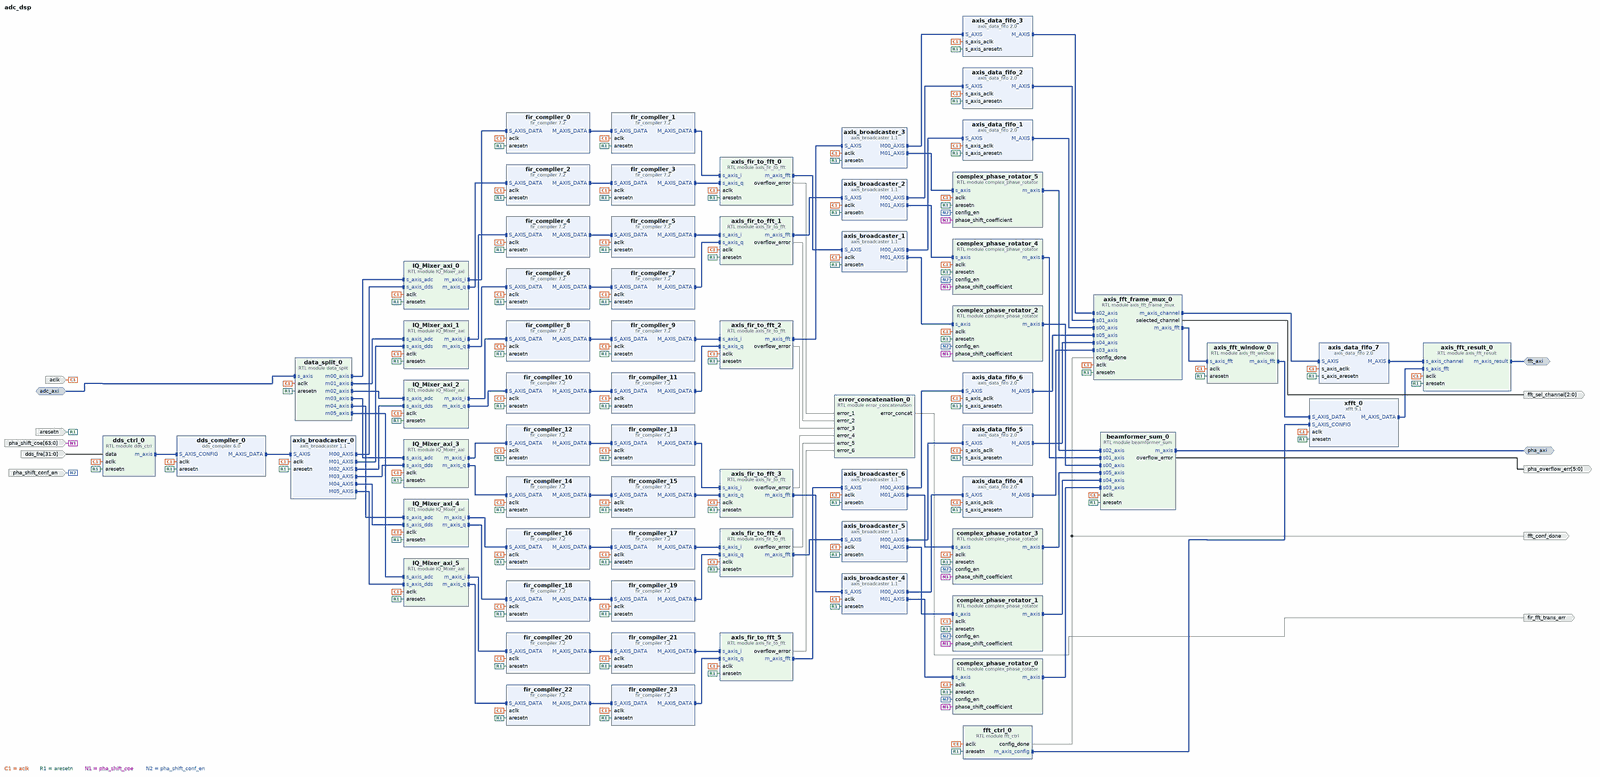
[diagram p0: block diagram of the top level, whole]
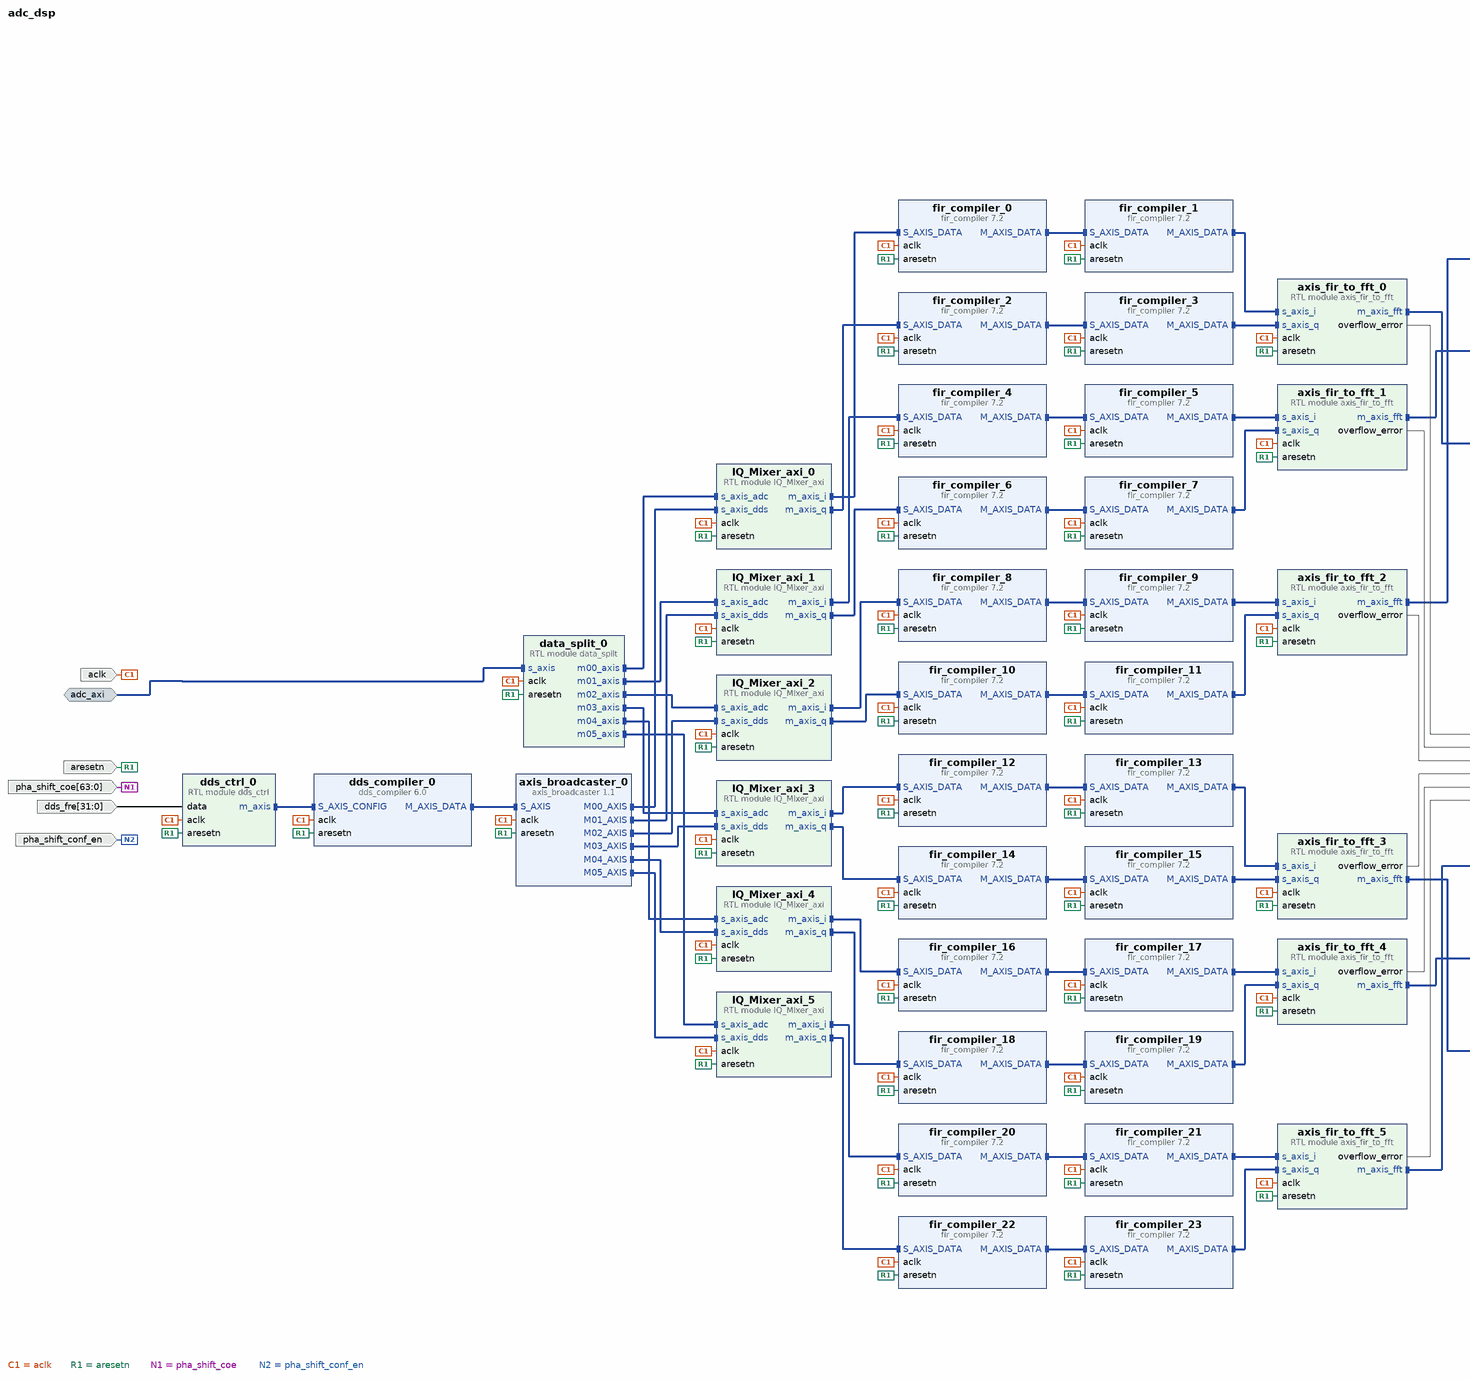
[diagram p1: block diagram of the top level, left part]
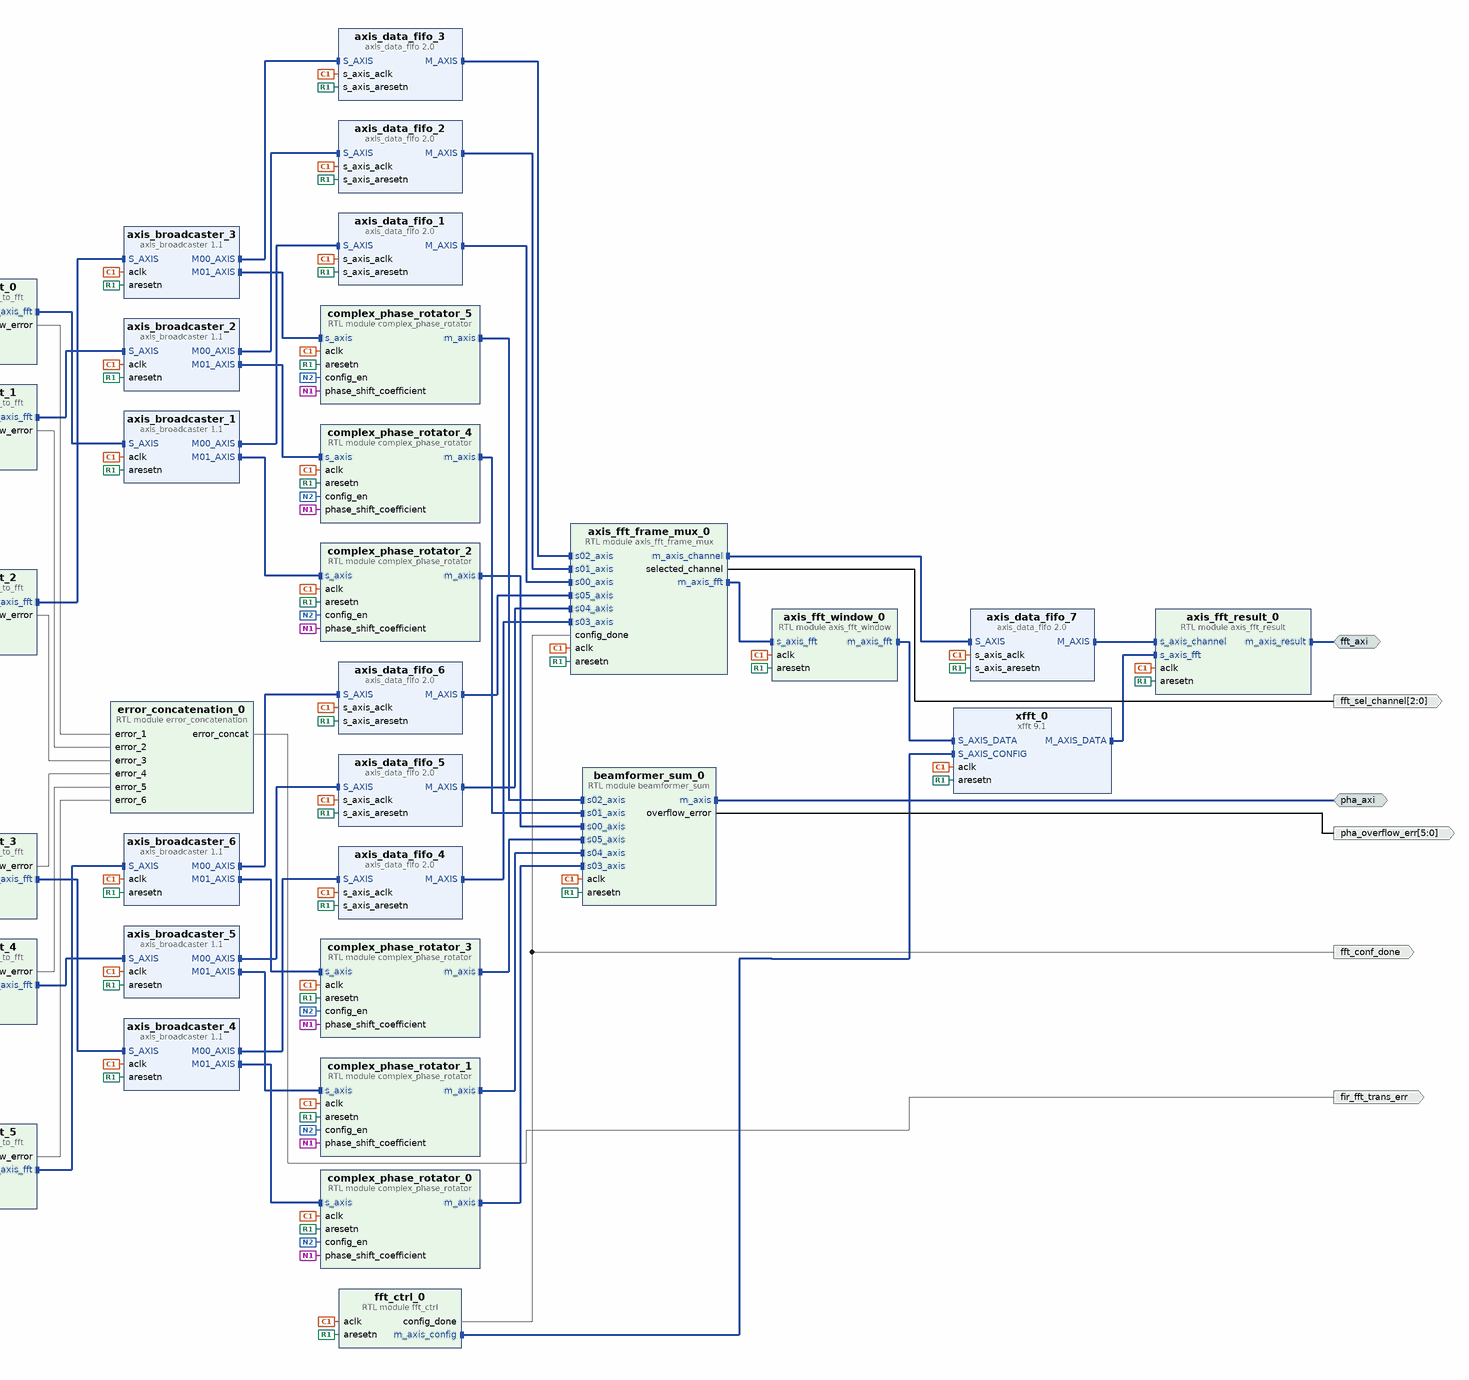
[diagram p2: block diagram of the top level, right part]
# Vivado block design adc_dsp, xc7z030ffg676-2, Vivado 2018.3
create_bd_design adc_dsp

create_bd_intf_port -mode Slave -vlnv xilinx.com:interface:axis_rtl:1.0 adc_axi
set_property -dict [list \
  CONFIG.HAS_TKEEP 0 \
  CONFIG.HAS_TLAST 0 \
  CONFIG.HAS_TREADY 1 \
  CONFIG.HAS_TSTRB 0 \
  CONFIG.LAYERED_METADATA undef \
  CONFIG.TDATA_NUM_BYTES 12 \
  CONFIG.TDEST_WIDTH 0 \
  CONFIG.TID_WIDTH 0 \
  CONFIG.TUSER_WIDTH 0 \
] [get_bd_intf_ports adc_axi]
create_bd_intf_port -mode Master -vlnv xilinx.com:interface:axis_rtl:1.0 fft_axi
create_bd_intf_port -mode Master -vlnv xilinx.com:interface:axis_rtl:1.0 pha_axi
create_bd_port -dir I -from 31 -to 0 dds_fre
create_bd_port -dir O fft_conf_done
create_bd_port -dir O fir_fft_trans_err
create_bd_port -dir I -type clk aclk
create_bd_port -dir I -type rst aresetn
create_bd_port -dir O -from 2 -to 0 fft_sel_channel
create_bd_port -dir O -from 5 -to 0 pha_overflow_err
create_bd_port -dir I -from 63 -to 0 pha_shift_coe
create_bd_port -dir I pha_shift_conf_en

create_bd_cell -type module -reference data_split data_split_0
create_bd_cell -type ip -vlnv xilinx.com:ip:dds_compiler:6.0 dds_compiler_0
set_property -dict [list \
  CONFIG.DATA_Has_TLAST Not_Required \
  CONFIG.Frequency_Resolution 0.4 \
  CONFIG.Has_ARESETn true \
  CONFIG.Has_Phase_Out false \
  CONFIG.Has_TREADY true \
  CONFIG.Latency 16 \
  CONFIG.Latency_Configuration Auto \
  CONFIG.M_DATA_Has_TUSER Not_Required \
  CONFIG.Negative_Sine true \
  CONFIG.Noise_Shaping Taylor_Series_Corrected \
  CONFIG.Output_Frequency1 0 \
  CONFIG.Output_Width 24 \
  CONFIG.PINC1 0 \
  CONFIG.Parameter_Entry Hardware_Parameters \
  CONFIG.Phase_Increment Programmable \
  CONFIG.Phase_Width 32 \
  CONFIG.S_PHASE_Has_TUSER Not_Required \
] [get_bd_cells dds_compiler_0]
create_bd_cell -type ip -vlnv xilinx.com:ip:axis_broadcaster:1.1 axis_broadcaster_0
set_property -dict [list \
  CONFIG.HAS_TREADY 1 \
  CONFIG.M00_TDATA_REMAP {tdata[47:0]} \
  CONFIG.M01_TDATA_REMAP {tdata[47:0]} \
  CONFIG.M02_TDATA_REMAP {tdata[47:0]} \
  CONFIG.M03_TDATA_REMAP {tdata[47:0]} \
  CONFIG.M04_TDATA_REMAP {tdata[47:0]} \
  CONFIG.M05_TDATA_REMAP {tdata[47:0]} \
  CONFIG.M_TDATA_NUM_BYTES 6 \
  CONFIG.NUM_MI 6 \
  CONFIG.S_TDATA_NUM_BYTES 6 \
] [get_bd_cells axis_broadcaster_0]
create_bd_cell -type module -reference dds_ctrl dds_ctrl_0
create_bd_cell -type ip -vlnv xilinx.com:ip:xfft:9.1 xfft_0
set_property -dict [list \
  CONFIG.aresetn true \
  CONFIG.channels 1 \
  CONFIG.implementation_options pipelined_streaming_io \
  CONFIG.input_width 26 \
  CONFIG.number_of_stages_using_block_ram_for_data_and_phase_factors 5 \
  CONFIG.output_ordering natural_order \
  CONFIG.phase_factor_width 24 \
  CONFIG.rounding_modes convergent_rounding \
  CONFIG.scaling_options unscaled \
  CONFIG.target_clock_frequency 100 \
  CONFIG.target_data_throughput 50 \
  CONFIG.transform_length 4096 \
  CONFIG.xk_index false \
] [get_bd_cells xfft_0]
create_bd_cell -type module -reference IQ_Mixer_axi IQ_Mixer_axi_0
create_bd_cell -type module -reference IQ_Mixer_axi IQ_Mixer_axi_1
create_bd_cell -type module -reference IQ_Mixer_axi IQ_Mixer_axi_2
create_bd_cell -type module -reference IQ_Mixer_axi IQ_Mixer_axi_3
create_bd_cell -type module -reference IQ_Mixer_axi IQ_Mixer_axi_4
create_bd_cell -type module -reference IQ_Mixer_axi IQ_Mixer_axi_5
create_bd_cell -type ip -vlnv xilinx.com:ip:axis_broadcaster:1.1 axis_broadcaster_1
set_property -dict [list \
  CONFIG.HAS_TLAST 1 \
  CONFIG.HAS_TREADY 1 \
  CONFIG.M00_TDATA_REMAP {tdata[63:0]} \
  CONFIG.M01_TDATA_REMAP {tdata[63:0]} \
  CONFIG.M02_TDATA_REMAP {tdata[47:0]} \
  CONFIG.M03_TDATA_REMAP {tdata[47:0]} \
  CONFIG.M04_TDATA_REMAP {tdata[47:0]} \
  CONFIG.M05_TDATA_REMAP {tdata[47:0]} \
  CONFIG.M_TDATA_NUM_BYTES 8 \
  CONFIG.NUM_MI 2 \
  CONFIG.S_TDATA_NUM_BYTES 8 \
] [get_bd_cells axis_broadcaster_1]
create_bd_cell -type ip -vlnv xilinx.com:ip:axis_broadcaster:1.1 axis_broadcaster_2
set_property -dict [list \
  CONFIG.HAS_TLAST 1 \
  CONFIG.HAS_TREADY 1 \
  CONFIG.M00_TDATA_REMAP {tdata[63:0]} \
  CONFIG.M01_TDATA_REMAP {tdata[63:0]} \
  CONFIG.M02_TDATA_REMAP {tdata[47:0]} \
  CONFIG.M03_TDATA_REMAP {tdata[47:0]} \
  CONFIG.M04_TDATA_REMAP {tdata[47:0]} \
  CONFIG.M05_TDATA_REMAP {tdata[47:0]} \
  CONFIG.M_TDATA_NUM_BYTES 8 \
  CONFIG.NUM_MI 2 \
  CONFIG.S_TDATA_NUM_BYTES 8 \
] [get_bd_cells axis_broadcaster_2]
create_bd_cell -type ip -vlnv xilinx.com:ip:axis_broadcaster:1.1 axis_broadcaster_3
set_property -dict [list \
  CONFIG.HAS_TLAST 1 \
  CONFIG.HAS_TREADY 1 \
  CONFIG.M00_TDATA_REMAP {tdata[63:0]} \
  CONFIG.M01_TDATA_REMAP {tdata[63:0]} \
  CONFIG.M02_TDATA_REMAP {tdata[47:0]} \
  CONFIG.M03_TDATA_REMAP {tdata[47:0]} \
  CONFIG.M04_TDATA_REMAP {tdata[47:0]} \
  CONFIG.M05_TDATA_REMAP {tdata[47:0]} \
  CONFIG.M_TDATA_NUM_BYTES 8 \
  CONFIG.NUM_MI 2 \
  CONFIG.S_TDATA_NUM_BYTES 8 \
] [get_bd_cells axis_broadcaster_3]
create_bd_cell -type ip -vlnv xilinx.com:ip:axis_broadcaster:1.1 axis_broadcaster_4
set_property -dict [list \
  CONFIG.HAS_TLAST 1 \
  CONFIG.HAS_TREADY 1 \
  CONFIG.M00_TDATA_REMAP {tdata[63:0]} \
  CONFIG.M01_TDATA_REMAP {tdata[63:0]} \
  CONFIG.M02_TDATA_REMAP {tdata[47:0]} \
  CONFIG.M03_TDATA_REMAP {tdata[47:0]} \
  CONFIG.M04_TDATA_REMAP {tdata[47:0]} \
  CONFIG.M05_TDATA_REMAP {tdata[47:0]} \
  CONFIG.M_TDATA_NUM_BYTES 8 \
  CONFIG.NUM_MI 2 \
  CONFIG.S_TDATA_NUM_BYTES 8 \
] [get_bd_cells axis_broadcaster_4]
create_bd_cell -type ip -vlnv xilinx.com:ip:axis_broadcaster:1.1 axis_broadcaster_5
set_property -dict [list \
  CONFIG.HAS_TLAST 1 \
  CONFIG.HAS_TREADY 1 \
  CONFIG.M00_TDATA_REMAP {tdata[63:0]} \
  CONFIG.M01_TDATA_REMAP {tdata[63:0]} \
  CONFIG.M02_TDATA_REMAP {tdata[47:0]} \
  CONFIG.M03_TDATA_REMAP {tdata[47:0]} \
  CONFIG.M04_TDATA_REMAP {tdata[47:0]} \
  CONFIG.M05_TDATA_REMAP {tdata[47:0]} \
  CONFIG.M_TDATA_NUM_BYTES 8 \
  CONFIG.NUM_MI 2 \
  CONFIG.S_TDATA_NUM_BYTES 8 \
] [get_bd_cells axis_broadcaster_5]
create_bd_cell -type ip -vlnv xilinx.com:ip:axis_broadcaster:1.1 axis_broadcaster_6
set_property -dict [list \
  CONFIG.HAS_TLAST 1 \
  CONFIG.HAS_TREADY 1 \
  CONFIG.M00_TDATA_REMAP {tdata[63:0]} \
  CONFIG.M01_TDATA_REMAP {tdata[63:0]} \
  CONFIG.M02_TDATA_REMAP {tdata[47:0]} \
  CONFIG.M03_TDATA_REMAP {tdata[47:0]} \
  CONFIG.M04_TDATA_REMAP {tdata[47:0]} \
  CONFIG.M05_TDATA_REMAP {tdata[47:0]} \
  CONFIG.M_TDATA_NUM_BYTES 8 \
  CONFIG.NUM_MI 2 \
  CONFIG.S_TDATA_NUM_BYTES 8 \
] [get_bd_cells axis_broadcaster_6]
create_bd_cell -type module -reference fft_ctrl fft_ctrl_0
create_bd_cell -type ip -vlnv xilinx.com:ip:fir_compiler:7.2 fir_compiler_0
set_property -dict [list \
  CONFIG.Clock_Frequency 100 \
  CONFIG.CoefficientSource COE_File \
  CONFIG.Coefficient_File ../../../../../../fpai_demo_vivado.srcs/adc_dsp/coe/stage1_hb_19taps_w18_q17.coe \
  CONFIG.Coefficient_Fractional_Bits 0 \
  CONFIG.Coefficient_Sets 1 \
  CONFIG.Coefficient_Sign Signed \
  CONFIG.Coefficient_Structure Inferred \
  CONFIG.Coefficient_Width 18 \
  CONFIG.ColumnConfig 3 \
  CONFIG.Data_Fractional_Bits 0 \
  CONFIG.Data_Sign Signed \
  CONFIG.Data_Width 24 \
  CONFIG.Decimation_Rate 2 \
  CONFIG.Filter_Architecture Systolic_Multiply_Accumulate \
  CONFIG.Filter_Type Decimation \
  CONFIG.Has_ARESETn true \
  CONFIG.Interpolation_Rate 1 \
  CONFIG.M_DATA_Has_TREADY true \
  CONFIG.Number_Channels 1 \
  CONFIG.Output_Rounding_Mode Convergent_Rounding_to_Even \
  CONFIG.Output_Width 24 \
  CONFIG.Quantization Integer_Coefficients \
  CONFIG.RateSpecification Frequency_Specification \
  CONFIG.Sample_Frequency 100 \
  CONFIG.Zero_Pack_Factor 1 \
] [get_bd_cells fir_compiler_0]
create_bd_cell -type ip -vlnv xilinx.com:ip:fir_compiler:7.2 fir_compiler_1
set_property -dict [list \
  CONFIG.Clock_Frequency 100 \
  CONFIG.CoefficientSource COE_File \
  CONFIG.Coefficient_File ../../../../../../fpai_demo_vivado.srcs/adc_dsp/coe/stage2_lp_80taps_w18_q17.coe \
  CONFIG.Coefficient_Fractional_Bits 0 \
  CONFIG.Coefficient_Sets 1 \
  CONFIG.Coefficient_Sign Signed \
  CONFIG.Coefficient_Structure Inferred \
  CONFIG.Coefficient_Width 18 \
  CONFIG.ColumnConfig 10 \
  CONFIG.Data_Width 24 \
  CONFIG.Decimation_Rate 2 \
  CONFIG.Filter_Architecture Systolic_Multiply_Accumulate \
  CONFIG.Filter_Type Decimation \
  CONFIG.Has_ARESETn true \
  CONFIG.Interpolation_Rate 1 \
  CONFIG.M_DATA_Has_TREADY true \
  CONFIG.Number_Channels 1 \
  CONFIG.Output_Rounding_Mode Full_Precision \
  CONFIG.Output_Width 42 \
  CONFIG.Quantization Integer_Coefficients \
  CONFIG.RateSpecification Frequency_Specification \
  CONFIG.Sample_Frequency 50 \
  CONFIG.Zero_Pack_Factor 1 \
] [get_bd_cells fir_compiler_1]
create_bd_cell -type ip -vlnv xilinx.com:ip:fir_compiler:7.2 fir_compiler_2
set_property -dict [list \
  CONFIG.Clock_Frequency 100 \
  CONFIG.CoefficientSource COE_File \
  CONFIG.Coefficient_File ../../../../../../fpai_demo_vivado.srcs/adc_dsp/coe/stage1_hb_19taps_w18_q17.coe \
  CONFIG.Coefficient_Fractional_Bits 0 \
  CONFIG.Coefficient_Sets 1 \
  CONFIG.Coefficient_Sign Signed \
  CONFIG.Coefficient_Structure Inferred \
  CONFIG.Coefficient_Width 18 \
  CONFIG.ColumnConfig 3 \
  CONFIG.Data_Fractional_Bits 0 \
  CONFIG.Data_Sign Signed \
  CONFIG.Data_Width 24 \
  CONFIG.Decimation_Rate 2 \
  CONFIG.Filter_Architecture Systolic_Multiply_Accumulate \
  CONFIG.Filter_Type Decimation \
  CONFIG.Has_ARESETn true \
  CONFIG.Interpolation_Rate 1 \
  CONFIG.M_DATA_Has_TREADY true \
  CONFIG.Number_Channels 1 \
  CONFIG.Output_Rounding_Mode Convergent_Rounding_to_Even \
  CONFIG.Output_Width 24 \
  CONFIG.Quantization Integer_Coefficients \
  CONFIG.RateSpecification Frequency_Specification \
  CONFIG.Sample_Frequency 100 \
  CONFIG.Zero_Pack_Factor 1 \
] [get_bd_cells fir_compiler_2]
create_bd_cell -type ip -vlnv xilinx.com:ip:fir_compiler:7.2 fir_compiler_3
set_property -dict [list \
  CONFIG.Clock_Frequency 100 \
  CONFIG.CoefficientSource COE_File \
  CONFIG.Coefficient_File ../../../../../../fpai_demo_vivado.srcs/adc_dsp/coe/stage2_lp_80taps_w18_q17.coe \
  CONFIG.Coefficient_Fractional_Bits 0 \
  CONFIG.Coefficient_Sets 1 \
  CONFIG.Coefficient_Sign Signed \
  CONFIG.Coefficient_Structure Inferred \
  CONFIG.Coefficient_Width 18 \
  CONFIG.ColumnConfig 10 \
  CONFIG.Data_Width 24 \
  CONFIG.Decimation_Rate 2 \
  CONFIG.Filter_Architecture Systolic_Multiply_Accumulate \
  CONFIG.Filter_Type Decimation \
  CONFIG.Has_ARESETn true \
  CONFIG.Interpolation_Rate 1 \
  CONFIG.M_DATA_Has_TREADY true \
  CONFIG.Number_Channels 1 \
  CONFIG.Output_Rounding_Mode Full_Precision \
  CONFIG.Output_Width 42 \
  CONFIG.Quantization Integer_Coefficients \
  CONFIG.RateSpecification Frequency_Specification \
  CONFIG.Sample_Frequency 50 \
  CONFIG.Zero_Pack_Factor 1 \
] [get_bd_cells fir_compiler_3]
create_bd_cell -type ip -vlnv xilinx.com:ip:fir_compiler:7.2 fir_compiler_4
set_property -dict [list \
  CONFIG.Clock_Frequency 100 \
  CONFIG.CoefficientSource COE_File \
  CONFIG.Coefficient_File ../../../../../../fpai_demo_vivado.srcs/adc_dsp/coe/stage1_hb_19taps_w18_q17.coe \
  CONFIG.Coefficient_Fractional_Bits 0 \
  CONFIG.Coefficient_Sets 1 \
  CONFIG.Coefficient_Sign Signed \
  CONFIG.Coefficient_Structure Inferred \
  CONFIG.Coefficient_Width 18 \
  CONFIG.ColumnConfig 3 \
  CONFIG.Data_Fractional_Bits 0 \
  CONFIG.Data_Sign Signed \
  CONFIG.Data_Width 24 \
  CONFIG.Decimation_Rate 2 \
  CONFIG.Filter_Architecture Systolic_Multiply_Accumulate \
  CONFIG.Filter_Type Decimation \
  CONFIG.Has_ARESETn true \
  CONFIG.Interpolation_Rate 1 \
  CONFIG.M_DATA_Has_TREADY true \
  CONFIG.Number_Channels 1 \
  CONFIG.Output_Rounding_Mode Convergent_Rounding_to_Even \
  CONFIG.Output_Width 24 \
  CONFIG.Quantization Integer_Coefficients \
  CONFIG.RateSpecification Frequency_Specification \
  CONFIG.Sample_Frequency 100 \
  CONFIG.Zero_Pack_Factor 1 \
] [get_bd_cells fir_compiler_4]
create_bd_cell -type ip -vlnv xilinx.com:ip:fir_compiler:7.2 fir_compiler_5
set_property -dict [list \
  CONFIG.Clock_Frequency 100 \
  CONFIG.CoefficientSource COE_File \
  CONFIG.Coefficient_File ../../../../../../fpai_demo_vivado.srcs/adc_dsp/coe/stage2_lp_80taps_w18_q17.coe \
  CONFIG.Coefficient_Fractional_Bits 0 \
  CONFIG.Coefficient_Sets 1 \
  CONFIG.Coefficient_Sign Signed \
  CONFIG.Coefficient_Structure Inferred \
  CONFIG.Coefficient_Width 18 \
  CONFIG.ColumnConfig 10 \
  CONFIG.Data_Width 24 \
  CONFIG.Decimation_Rate 2 \
  CONFIG.Filter_Architecture Systolic_Multiply_Accumulate \
  CONFIG.Filter_Type Decimation \
  CONFIG.Has_ARESETn true \
  CONFIG.Interpolation_Rate 1 \
  CONFIG.M_DATA_Has_TREADY true \
  CONFIG.Number_Channels 1 \
  CONFIG.Output_Rounding_Mode Full_Precision \
  CONFIG.Output_Width 42 \
  CONFIG.Quantization Integer_Coefficients \
  CONFIG.RateSpecification Frequency_Specification \
  CONFIG.Sample_Frequency 50 \
  CONFIG.Zero_Pack_Factor 1 \
] [get_bd_cells fir_compiler_5]
create_bd_cell -type ip -vlnv xilinx.com:ip:fir_compiler:7.2 fir_compiler_6
set_property -dict [list \
  CONFIG.Clock_Frequency 100 \
  CONFIG.CoefficientSource COE_File \
  CONFIG.Coefficient_File ../../../../../../fpai_demo_vivado.srcs/adc_dsp/coe/stage1_hb_19taps_w18_q17.coe \
  CONFIG.Coefficient_Fractional_Bits 0 \
  CONFIG.Coefficient_Sets 1 \
  CONFIG.Coefficient_Sign Signed \
  CONFIG.Coefficient_Structure Inferred \
  CONFIG.Coefficient_Width 18 \
  CONFIG.ColumnConfig 3 \
  CONFIG.Data_Fractional_Bits 0 \
  CONFIG.Data_Sign Signed \
  CONFIG.Data_Width 24 \
  CONFIG.Decimation_Rate 2 \
  CONFIG.Filter_Architecture Systolic_Multiply_Accumulate \
  CONFIG.Filter_Type Decimation \
  CONFIG.Has_ARESETn true \
  CONFIG.Interpolation_Rate 1 \
  CONFIG.M_DATA_Has_TREADY true \
  CONFIG.Number_Channels 1 \
  CONFIG.Output_Rounding_Mode Convergent_Rounding_to_Even \
  CONFIG.Output_Width 24 \
  CONFIG.Quantization Integer_Coefficients \
  CONFIG.RateSpecification Frequency_Specification \
  CONFIG.Sample_Frequency 100 \
  CONFIG.Zero_Pack_Factor 1 \
] [get_bd_cells fir_compiler_6]
create_bd_cell -type ip -vlnv xilinx.com:ip:fir_compiler:7.2 fir_compiler_7
set_property -dict [list \
  CONFIG.Clock_Frequency 100 \
  CONFIG.CoefficientSource COE_File \
  CONFIG.Coefficient_File ../../../../../../fpai_demo_vivado.srcs/adc_dsp/coe/stage2_lp_80taps_w18_q17.coe \
  CONFIG.Coefficient_Fractional_Bits 0 \
  CONFIG.Coefficient_Sets 1 \
  CONFIG.Coefficient_Sign Signed \
  CONFIG.Coefficient_Structure Inferred \
  CONFIG.Coefficient_Width 18 \
  CONFIG.ColumnConfig 10 \
  CONFIG.Data_Width 24 \
  CONFIG.Decimation_Rate 2 \
  CONFIG.Filter_Architecture Systolic_Multiply_Accumulate \
  CONFIG.Filter_Type Decimation \
  CONFIG.Has_ARESETn true \
  CONFIG.Interpolation_Rate 1 \
  CONFIG.M_DATA_Has_TREADY true \
  CONFIG.Number_Channels 1 \
  CONFIG.Output_Rounding_Mode Full_Precision \
  CONFIG.Output_Width 42 \
  CONFIG.Quantization Integer_Coefficients \
  CONFIG.RateSpecification Frequency_Specification \
  CONFIG.Sample_Frequency 50 \
  CONFIG.Zero_Pack_Factor 1 \
] [get_bd_cells fir_compiler_7]
create_bd_cell -type ip -vlnv xilinx.com:ip:fir_compiler:7.2 fir_compiler_8
set_property -dict [list \
  CONFIG.Clock_Frequency 100 \
  CONFIG.CoefficientSource COE_File \
  CONFIG.Coefficient_File ../../../../../../fpai_demo_vivado.srcs/adc_dsp/coe/stage1_hb_19taps_w18_q17.coe \
  CONFIG.Coefficient_Fractional_Bits 0 \
  CONFIG.Coefficient_Sets 1 \
  CONFIG.Coefficient_Sign Signed \
  CONFIG.Coefficient_Structure Inferred \
  CONFIG.Coefficient_Width 18 \
  CONFIG.ColumnConfig 3 \
  CONFIG.Data_Fractional_Bits 0 \
  CONFIG.Data_Sign Signed \
  CONFIG.Data_Width 24 \
  CONFIG.Decimation_Rate 2 \
  CONFIG.Filter_Architecture Systolic_Multiply_Accumulate \
  CONFIG.Filter_Type Decimation \
  CONFIG.Has_ARESETn true \
  CONFIG.Interpolation_Rate 1 \
  CONFIG.M_DATA_Has_TREADY true \
  CONFIG.Number_Channels 1 \
  CONFIG.Output_Rounding_Mode Convergent_Rounding_to_Even \
  CONFIG.Output_Width 24 \
  CONFIG.Quantization Integer_Coefficients \
  CONFIG.RateSpecification Frequency_Specification \
  CONFIG.Sample_Frequency 100 \
  CONFIG.Zero_Pack_Factor 1 \
] [get_bd_cells fir_compiler_8]
create_bd_cell -type ip -vlnv xilinx.com:ip:fir_compiler:7.2 fir_compiler_9
set_property -dict [list \
  CONFIG.Clock_Frequency 100 \
  CONFIG.CoefficientSource COE_File \
  CONFIG.Coefficient_File ../../../../../../fpai_demo_vivado.srcs/adc_dsp/coe/stage2_lp_80taps_w18_q17.coe \
  CONFIG.Coefficient_Fractional_Bits 0 \
  CONFIG.Coefficient_Sets 1 \
  CONFIG.Coefficient_Sign Signed \
  CONFIG.Coefficient_Structure Inferred \
  CONFIG.Coefficient_Width 18 \
  CONFIG.ColumnConfig 10 \
  CONFIG.Data_Width 24 \
  CONFIG.Decimation_Rate 2 \
  CONFIG.Filter_Architecture Systolic_Multiply_Accumulate \
  CONFIG.Filter_Type Decimation \
  CONFIG.Has_ARESETn true \
  CONFIG.Interpolation_Rate 1 \
  CONFIG.M_DATA_Has_TREADY true \
  CONFIG.Number_Channels 1 \
  CONFIG.Output_Rounding_Mode Full_Precision \
  CONFIG.Output_Width 42 \
  CONFIG.Quantization Integer_Coefficients \
  CONFIG.RateSpecification Frequency_Specification \
  CONFIG.Sample_Frequency 50 \
  CONFIG.Zero_Pack_Factor 1 \
] [get_bd_cells fir_compiler_9]
create_bd_cell -type ip -vlnv xilinx.com:ip:fir_compiler:7.2 fir_compiler_10
set_property -dict [list \
  CONFIG.Clock_Frequency 100 \
  CONFIG.CoefficientSource COE_File \
  CONFIG.Coefficient_File ../../../../../../fpai_demo_vivado.srcs/adc_dsp/coe/stage1_hb_19taps_w18_q17.coe \
  CONFIG.Coefficient_Fractional_Bits 0 \
  CONFIG.Coefficient_Sets 1 \
  CONFIG.Coefficient_Sign Signed \
  CONFIG.Coefficient_Structure Inferred \
  CONFIG.Coefficient_Width 18 \
  CONFIG.ColumnConfig 3 \
  CONFIG.Data_Fractional_Bits 0 \
  CONFIG.Data_Sign Signed \
  CONFIG.Data_Width 24 \
  CONFIG.Decimation_Rate 2 \
  CONFIG.Filter_Architecture Systolic_Multiply_Accumulate \
  CONFIG.Filter_Type Decimation \
  CONFIG.Has_ARESETn true \
  CONFIG.Interpolation_Rate 1 \
  CONFIG.M_DATA_Has_TREADY true \
  CONFIG.Number_Channels 1 \
  CONFIG.Output_Rounding_Mode Convergent_Rounding_to_Even \
  CONFIG.Output_Width 24 \
  CONFIG.Quantization Integer_Coefficients \
  CONFIG.RateSpecification Frequency_Specification \
  CONFIG.Sample_Frequency 100 \
  CONFIG.Zero_Pack_Factor 1 \
] [get_bd_cells fir_compiler_10]
create_bd_cell -type ip -vlnv xilinx.com:ip:fir_compiler:7.2 fir_compiler_11
set_property -dict [list \
  CONFIG.Clock_Frequency 100 \
  CONFIG.CoefficientSource COE_File \
  CONFIG.Coefficient_File ../../../../../../fpai_demo_vivado.srcs/adc_dsp/coe/stage2_lp_80taps_w18_q17.coe \
  CONFIG.Coefficient_Fractional_Bits 0 \
  CONFIG.Coefficient_Sets 1 \
  CONFIG.Coefficient_Sign Signed \
  CONFIG.Coefficient_Structure Inferred \
  CONFIG.Coefficient_Width 18 \
  CONFIG.ColumnConfig 10 \
  CONFIG.Data_Width 24 \
  CONFIG.Decimation_Rate 2 \
  CONFIG.Filter_Architecture Systolic_Multiply_Accumulate \
  CONFIG.Filter_Type Decimation \
  CONFIG.Has_ARESETn true \
  CONFIG.Interpolation_Rate 1 \
  CONFIG.M_DATA_Has_TREADY true \
  CONFIG.Number_Channels 1 \
  CONFIG.Output_Rounding_Mode Full_Precision \
  CONFIG.Output_Width 42 \
  CONFIG.Quantization Integer_Coefficients \
  CONFIG.RateSpecification Frequency_Specification \
  CONFIG.Sample_Frequency 50 \
  CONFIG.Zero_Pack_Factor 1 \
] [get_bd_cells fir_compiler_11]
create_bd_cell -type ip -vlnv xilinx.com:ip:fir_compiler:7.2 fir_compiler_12
set_property -dict [list \
  CONFIG.Clock_Frequency 100 \
  CONFIG.CoefficientSource COE_File \
  CONFIG.Coefficient_File ../../../../../../fpai_demo_vivado.srcs/adc_dsp/coe/stage1_hb_19taps_w18_q17.coe \
  CONFIG.Coefficient_Fractional_Bits 0 \
  CONFIG.Coefficient_Sets 1 \
  CONFIG.Coefficient_Sign Signed \
  CONFIG.Coefficient_Structure Inferred \
  CONFIG.Coefficient_Width 18 \
  CONFIG.ColumnConfig 3 \
  CONFIG.Data_Fractional_Bits 0 \
  CONFIG.Data_Sign Signed \
  CONFIG.Data_Width 24 \
  CONFIG.Decimation_Rate 2 \
  CONFIG.Filter_Architecture Systolic_Multiply_Accumulate \
  CONFIG.Filter_Type Decimation \
  CONFIG.Has_ARESETn true \
  CONFIG.Interpolation_Rate 1 \
  CONFIG.M_DATA_Has_TREADY true \
  CONFIG.Number_Channels 1 \
  CONFIG.Output_Rounding_Mode Convergent_Rounding_to_Even \
  CONFIG.Output_Width 24 \
  CONFIG.Quantization Integer_Coefficients \
  CONFIG.RateSpecification Frequency_Specification \
  CONFIG.Sample_Frequency 100 \
  CONFIG.Zero_Pack_Factor 1 \
] [get_bd_cells fir_compiler_12]
create_bd_cell -type ip -vlnv xilinx.com:ip:fir_compiler:7.2 fir_compiler_13
set_property -dict [list \
  CONFIG.Clock_Frequency 100 \
  CONFIG.CoefficientSource COE_File \
  CONFIG.Coefficient_File ../../../../../../fpai_demo_vivado.srcs/adc_dsp/coe/stage2_lp_80taps_w18_q17.coe \
  CONFIG.Coefficient_Fractional_Bits 0 \
  CONFIG.Coefficient_Sets 1 \
  CONFIG.Coefficient_Sign Signed \
  CONFIG.Coefficient_Structure Inferred \
  CONFIG.Coefficient_Width 18 \
  CONFIG.ColumnConfig 10 \
  CONFIG.Data_Width 24 \
  CONFIG.Decimation_Rate 2 \
  CONFIG.Filter_Architecture Systolic_Multiply_Accumulate \
  CONFIG.Filter_Type Decimation \
  CONFIG.Has_ARESETn true \
  CONFIG.Interpolation_Rate 1 \
  CONFIG.M_DATA_Has_TREADY true \
  CONFIG.Number_Channels 1 \
  CONFIG.Output_Rounding_Mode Full_Precision \
  CONFIG.Output_Width 42 \
  CONFIG.Quantization Integer_Coefficients \
  CONFIG.RateSpecification Frequency_Specification \
  CONFIG.Sample_Frequency 50 \
  CONFIG.Zero_Pack_Factor 1 \
] [get_bd_cells fir_compiler_13]
create_bd_cell -type ip -vlnv xilinx.com:ip:fir_compiler:7.2 fir_compiler_14
set_property -dict [list \
  CONFIG.Clock_Frequency 100 \
  CONFIG.CoefficientSource COE_File \
  CONFIG.Coefficient_File ../../../../../../fpai_demo_vivado.srcs/adc_dsp/coe/stage1_hb_19taps_w18_q17.coe \
  CONFIG.Coefficient_Fractional_Bits 0 \
  CONFIG.Coefficient_Sets 1 \
  CONFIG.Coefficient_Sign Signed \
  CONFIG.Coefficient_Structure Inferred \
  CONFIG.Coefficient_Width 18 \
  CONFIG.ColumnConfig 3 \
  CONFIG.Data_Fractional_Bits 0 \
  CONFIG.Data_Sign Signed \
  CONFIG.Data_Width 24 \
  CONFIG.Decimation_Rate 2 \
  CONFIG.Filter_Architecture Systolic_Multiply_Accumulate \
  CONFIG.Filter_Type Decimation \
  CONFIG.Has_ARESETn true \
  CONFIG.Interpolation_Rate 1 \
  CONFIG.M_DATA_Has_TREADY true \
  CONFIG.Number_Channels 1 \
  CONFIG.Output_Rounding_Mode Convergent_Rounding_to_Even \
  CONFIG.Output_Width 24 \
  CONFIG.Quantization Integer_Coefficients \
  CONFIG.RateSpecification Frequency_Specification \
  CONFIG.Sample_Frequency 100 \
  CONFIG.Zero_Pack_Factor 1 \
] [get_bd_cells fir_compiler_14]
create_bd_cell -type ip -vlnv xilinx.com:ip:fir_compiler:7.2 fir_compiler_15
set_property -dict [list \
  CONFIG.Clock_Frequency 100 \
  CONFIG.CoefficientSource COE_File \
  CONFIG.Coefficient_File ../../../../../../fpai_demo_vivado.srcs/adc_dsp/coe/stage2_lp_80taps_w18_q17.coe \
  CONFIG.Coefficient_Fractional_Bits 0 \
  CONFIG.Coefficient_Sets 1 \
  CONFIG.Coefficient_Sign Signed \
  CONFIG.Coefficient_Structure Inferred \
  CONFIG.Coefficient_Width 18 \
  CONFIG.ColumnConfig 10 \
  CONFIG.Data_Width 24 \
  CONFIG.Decimation_Rate 2 \
  CONFIG.Filter_Architecture Systolic_Multiply_Accumulate \
  CONFIG.Filter_Type Decimation \
  CONFIG.Has_ARESETn true \
  CONFIG.Interpolation_Rate 1 \
  CONFIG.M_DATA_Has_TREADY true \
  CONFIG.Number_Channels 1 \
  CONFIG.Output_Rounding_Mode Full_Precision \
  CONFIG.Output_Width 42 \
  CONFIG.Quantization Integer_Coefficients \
  CONFIG.RateSpecification Frequency_Specification \
  CONFIG.Sample_Frequency 50 \
  CONFIG.Zero_Pack_Factor 1 \
] [get_bd_cells fir_compiler_15]
create_bd_cell -type ip -vlnv xilinx.com:ip:fir_compiler:7.2 fir_compiler_16
set_property -dict [list \
  CONFIG.Clock_Frequency 100 \
  CONFIG.CoefficientSource COE_File \
  CONFIG.Coefficient_File ../../../../../../fpai_demo_vivado.srcs/adc_dsp/coe/stage1_hb_19taps_w18_q17.coe \
  CONFIG.Coefficient_Fractional_Bits 0 \
  CONFIG.Coefficient_Sets 1 \
  CONFIG.Coefficient_Sign Signed \
  CONFIG.Coefficient_Structure Inferred \
  CONFIG.Coefficient_Width 18 \
  CONFIG.ColumnConfig 3 \
  CONFIG.Data_Fractional_Bits 0 \
  CONFIG.Data_Sign Signed \
  CONFIG.Data_Width 24 \
  CONFIG.Decimation_Rate 2 \
  CONFIG.Filter_Architecture Systolic_Multiply_Accumulate \
  CONFIG.Filter_Type Decimation \
  CONFIG.Has_ARESETn true \
  CONFIG.Interpolation_Rate 1 \
  CONFIG.M_DATA_Has_TREADY true \
  CONFIG.Number_Channels 1 \
  CONFIG.Output_Rounding_Mode Convergent_Rounding_to_Even \
  CONFIG.Output_Width 24 \
  CONFIG.Quantization Integer_Coefficients \
  CONFIG.RateSpecification Frequency_Specification \
  CONFIG.Sample_Frequency 100 \
  CONFIG.Zero_Pack_Factor 1 \
] [get_bd_cells fir_compiler_16]
create_bd_cell -type ip -vlnv xilinx.com:ip:fir_compiler:7.2 fir_compiler_17
set_property -dict [list \
  CONFIG.Clock_Frequency 100 \
  CONFIG.CoefficientSource COE_File \
  CONFIG.Coefficient_File ../../../../../../fpai_demo_vivado.srcs/adc_dsp/coe/stage2_lp_80taps_w18_q17.coe \
  CONFIG.Coefficient_Fractional_Bits 0 \
  CONFIG.Coefficient_Sets 1 \
  CONFIG.Coefficient_Sign Signed \
  CONFIG.Coefficient_Structure Inferred \
  CONFIG.Coefficient_Width 18 \
  CONFIG.ColumnConfig 10 \
  CONFIG.Data_Width 24 \
  CONFIG.Decimation_Rate 2 \
  CONFIG.Filter_Architecture Systolic_Multiply_Accumulate \
  CONFIG.Filter_Type Decimation \
  CONFIG.Has_ARESETn true \
  CONFIG.Interpolation_Rate 1 \
  CONFIG.M_DATA_Has_TREADY true \
  CONFIG.Number_Channels 1 \
  CONFIG.Output_Rounding_Mode Full_Precision \
  CONFIG.Output_Width 42 \
  CONFIG.Quantization Integer_Coefficients \
  CONFIG.RateSpecification Frequency_Specification \
  CONFIG.Sample_Frequency 50 \
  CONFIG.Zero_Pack_Factor 1 \
] [get_bd_cells fir_compiler_17]
create_bd_cell -type ip -vlnv xilinx.com:ip:fir_compiler:7.2 fir_compiler_18
set_property -dict [list \
  CONFIG.Clock_Frequency 100 \
  CONFIG.CoefficientSource COE_File \
  CONFIG.Coefficient_File ../../../../../../fpai_demo_vivado.srcs/adc_dsp/coe/stage1_hb_19taps_w18_q17.coe \
  CONFIG.Coefficient_Fractional_Bits 0 \
  CONFIG.Coefficient_Sets 1 \
  CONFIG.Coefficient_Sign Signed \
  CONFIG.Coefficient_Structure Inferred \
  CONFIG.Coefficient_Width 18 \
  CONFIG.ColumnConfig 3 \
  CONFIG.Data_Fractional_Bits 0 \
  CONFIG.Data_Sign Signed \
  CONFIG.Data_Width 24 \
  CONFIG.Decimation_Rate 2 \
  CONFIG.Filter_Architecture Systolic_Multiply_Accumulate \
  CONFIG.Filter_Type Decimation \
  CONFIG.Has_ARESETn true \
  CONFIG.Interpolation_Rate 1 \
  CONFIG.M_DATA_Has_TREADY true \
  CONFIG.Number_Channels 1 \
  CONFIG.Output_Rounding_Mode Convergent_Rounding_to_Even \
  CONFIG.Output_Width 24 \
  CONFIG.Quantization Integer_Coefficients \
  CONFIG.RateSpecification Frequency_Specification \
  CONFIG.Sample_Frequency 100 \
  CONFIG.Zero_Pack_Factor 1 \
] [get_bd_cells fir_compiler_18]
create_bd_cell -type ip -vlnv xilinx.com:ip:fir_compiler:7.2 fir_compiler_19
set_property -dict [list \
  CONFIG.Clock_Frequency 100 \
  CONFIG.CoefficientSource COE_File \
  CONFIG.Coefficient_File ../../../../../../fpai_demo_vivado.srcs/adc_dsp/coe/stage2_lp_80taps_w18_q17.coe \
  CONFIG.Coefficient_Fractional_Bits 0 \
  CONFIG.Coefficient_Sets 1 \
  CONFIG.Coefficient_Sign Signed \
  CONFIG.Coefficient_Structure Inferred \
  CONFIG.Coefficient_Width 18 \
  CONFIG.ColumnConfig 10 \
  CONFIG.Data_Width 24 \
  CONFIG.Decimation_Rate 2 \
  CONFIG.Filter_Architecture Systolic_Multiply_Accumulate \
  CONFIG.Filter_Type Decimation \
  CONFIG.Has_ARESETn true \
  CONFIG.Interpolation_Rate 1 \
  CONFIG.M_DATA_Has_TREADY true \
  CONFIG.Number_Channels 1 \
  CONFIG.Output_Rounding_Mode Full_Precision \
  CONFIG.Output_Width 42 \
  CONFIG.Quantization Integer_Coefficients \
  CONFIG.RateSpecification Frequency_Specification \
  CONFIG.Sample_Frequency 50 \
  CONFIG.Zero_Pack_Factor 1 \
] [get_bd_cells fir_compiler_19]
create_bd_cell -type ip -vlnv xilinx.com:ip:fir_compiler:7.2 fir_compiler_20
set_property -dict [list \
  CONFIG.Clock_Frequency 100 \
  CONFIG.CoefficientSource COE_File \
  CONFIG.Coefficient_File ../../../../../../fpai_demo_vivado.srcs/adc_dsp/coe/stage1_hb_19taps_w18_q17.coe \
  CONFIG.Coefficient_Fractional_Bits 0 \
  CONFIG.Coefficient_Sets 1 \
  CONFIG.Coefficient_Sign Signed \
  CONFIG.Coefficient_Structure Inferred \
  CONFIG.Coefficient_Width 18 \
  CONFIG.ColumnConfig 3 \
  CONFIG.Data_Fractional_Bits 0 \
  CONFIG.Data_Sign Signed \
  CONFIG.Data_Width 24 \
  CONFIG.Decimation_Rate 2 \
  CONFIG.Filter_Architecture Systolic_Multiply_Accumulate \
  CONFIG.Filter_Type Decimation \
  CONFIG.Has_ARESETn true \
  CONFIG.Interpolation_Rate 1 \
  CONFIG.M_DATA_Has_TREADY true \
  CONFIG.Number_Channels 1 \
  CONFIG.Output_Rounding_Mode Convergent_Rounding_to_Even \
  CONFIG.Output_Width 24 \
  CONFIG.Quantization Integer_Coefficients \
  CONFIG.RateSpecification Frequency_Specification \
  CONFIG.Sample_Frequency 100 \
  CONFIG.Zero_Pack_Factor 1 \
] [get_bd_cells fir_compiler_20]
create_bd_cell -type ip -vlnv xilinx.com:ip:fir_compiler:7.2 fir_compiler_21
set_property -dict [list \
  CONFIG.Clock_Frequency 100 \
  CONFIG.CoefficientSource COE_File \
  CONFIG.Coefficient_File ../../../../../../fpai_demo_vivado.srcs/adc_dsp/coe/stage2_lp_80taps_w18_q17.coe \
  CONFIG.Coefficient_Fractional_Bits 0 \
  CONFIG.Coefficient_Sets 1 \
  CONFIG.Coefficient_Sign Signed \
  CONFIG.Coefficient_Structure Inferred \
  CONFIG.Coefficient_Width 18 \
  CONFIG.ColumnConfig 10 \
  CONFIG.Data_Width 24 \
  CONFIG.Decimation_Rate 2 \
  CONFIG.Filter_Architecture Systolic_Multiply_Accumulate \
  CONFIG.Filter_Type Decimation \
  CONFIG.Has_ARESETn true \
  CONFIG.Interpolation_Rate 1 \
  CONFIG.M_DATA_Has_TREADY true \
  CONFIG.Number_Channels 1 \
  CONFIG.Output_Rounding_Mode Full_Precision \
  CONFIG.Output_Width 42 \
  CONFIG.Quantization Integer_Coefficients \
  CONFIG.RateSpecification Frequency_Specification \
  CONFIG.Sample_Frequency 50 \
  CONFIG.Zero_Pack_Factor 1 \
] [get_bd_cells fir_compiler_21]
create_bd_cell -type ip -vlnv xilinx.com:ip:fir_compiler:7.2 fir_compiler_22
set_property -dict [list \
  CONFIG.Clock_Frequency 100 \
  CONFIG.CoefficientSource COE_File \
  CONFIG.Coefficient_File ../../../../../../fpai_demo_vivado.srcs/adc_dsp/coe/stage1_hb_19taps_w18_q17.coe \
  CONFIG.Coefficient_Fractional_Bits 0 \
  CONFIG.Coefficient_Sets 1 \
  CONFIG.Coefficient_Sign Signed \
  CONFIG.Coefficient_Structure Inferred \
  CONFIG.Coefficient_Width 18 \
  CONFIG.ColumnConfig 3 \
  CONFIG.Data_Fractional_Bits 0 \
  CONFIG.Data_Sign Signed \
  CONFIG.Data_Width 24 \
  CONFIG.Decimation_Rate 2 \
  CONFIG.Filter_Architecture Systolic_Multiply_Accumulate \
  CONFIG.Filter_Type Decimation \
  CONFIG.Has_ARESETn true \
  CONFIG.Interpolation_Rate 1 \
  CONFIG.M_DATA_Has_TREADY true \
  CONFIG.Number_Channels 1 \
  CONFIG.Output_Rounding_Mode Convergent_Rounding_to_Even \
  CONFIG.Output_Width 24 \
  CONFIG.Quantization Integer_Coefficients \
  CONFIG.RateSpecification Frequency_Specification \
  CONFIG.Sample_Frequency 100 \
  CONFIG.Zero_Pack_Factor 1 \
] [get_bd_cells fir_compiler_22]
create_bd_cell -type ip -vlnv xilinx.com:ip:fir_compiler:7.2 fir_compiler_23
set_property -dict [list \
  CONFIG.Clock_Frequency 100 \
  CONFIG.CoefficientSource COE_File \
  CONFIG.Coefficient_File ../../../../../../fpai_demo_vivado.srcs/adc_dsp/coe/stage2_lp_80taps_w18_q17.coe \
  CONFIG.Coefficient_Fractional_Bits 0 \
  CONFIG.Coefficient_Sets 1 \
  CONFIG.Coefficient_Sign Signed \
  CONFIG.Coefficient_Structure Inferred \
  CONFIG.Coefficient_Width 18 \
  CONFIG.ColumnConfig 10 \
  CONFIG.Data_Width 24 \
  CONFIG.Decimation_Rate 2 \
  CONFIG.Filter_Architecture Systolic_Multiply_Accumulate \
  CONFIG.Filter_Type Decimation \
  CONFIG.Has_ARESETn true \
  CONFIG.Interpolation_Rate 1 \
  CONFIG.M_DATA_Has_TREADY true \
  CONFIG.Number_Channels 1 \
  CONFIG.Output_Rounding_Mode Full_Precision \
  CONFIG.Output_Width 42 \
  CONFIG.Quantization Integer_Coefficients \
  CONFIG.RateSpecification Frequency_Specification \
  CONFIG.Sample_Frequency 50 \
  CONFIG.Zero_Pack_Factor 1 \
] [get_bd_cells fir_compiler_23]
create_bd_cell -type ip -vlnv xilinx.com:ip:axis_data_fifo:2.0 axis_data_fifo_1
set_property -dict {CONFIG.FIFO_DEPTH 8192 CONFIG.HAS_TLAST 1 CONFIG.TDATA_NUM_BYTES 8} [get_bd_cells axis_data_fifo_1]
create_bd_cell -type ip -vlnv xilinx.com:ip:axis_data_fifo:2.0 axis_data_fifo_2
set_property -dict {CONFIG.FIFO_DEPTH 8192 CONFIG.HAS_TLAST 1 CONFIG.TDATA_NUM_BYTES 8} [get_bd_cells axis_data_fifo_2]
create_bd_cell -type ip -vlnv xilinx.com:ip:axis_data_fifo:2.0 axis_data_fifo_3
set_property -dict {CONFIG.FIFO_DEPTH 8192 CONFIG.HAS_TLAST 1 CONFIG.TDATA_NUM_BYTES 8} [get_bd_cells axis_data_fifo_3]
create_bd_cell -type ip -vlnv xilinx.com:ip:axis_data_fifo:2.0 axis_data_fifo_4
set_property -dict {CONFIG.FIFO_DEPTH 8192 CONFIG.HAS_TLAST 1 CONFIG.TDATA_NUM_BYTES 8} [get_bd_cells axis_data_fifo_4]
create_bd_cell -type ip -vlnv xilinx.com:ip:axis_data_fifo:2.0 axis_data_fifo_5
set_property -dict {CONFIG.FIFO_DEPTH 8192 CONFIG.HAS_TLAST 1 CONFIG.TDATA_NUM_BYTES 8} [get_bd_cells axis_data_fifo_5]
create_bd_cell -type ip -vlnv xilinx.com:ip:axis_data_fifo:2.0 axis_data_fifo_6
set_property -dict {CONFIG.FIFO_DEPTH 8192 CONFIG.HAS_TLAST 1 CONFIG.TDATA_NUM_BYTES 8} [get_bd_cells axis_data_fifo_6]
create_bd_cell -type ip -vlnv xilinx.com:ip:axis_data_fifo:2.0 axis_data_fifo_7
set_property -dict {CONFIG.FIFO_DEPTH 16384 CONFIG.FIFO_MEMORY_TYPE auto CONFIG.TDATA_NUM_BYTES 1} [get_bd_cells axis_data_fifo_7]
create_bd_cell -type module -reference axis_fft_frame_mux axis_fft_frame_mux_0
create_bd_cell -type module -reference axis_fft_result axis_fft_result_0
create_bd_cell -type module -reference error_concatenation error_concatenation_0
create_bd_cell -type module -reference axis_fir_to_fft axis_fir_to_fft_0
create_bd_cell -type module -reference axis_fir_to_fft axis_fir_to_fft_1
create_bd_cell -type module -reference axis_fir_to_fft axis_fir_to_fft_2
create_bd_cell -type module -reference axis_fir_to_fft axis_fir_to_fft_3
create_bd_cell -type module -reference axis_fir_to_fft axis_fir_to_fft_4
create_bd_cell -type module -reference axis_fir_to_fft axis_fir_to_fft_5
create_bd_cell -type module -reference beamformer_sum beamformer_sum_0
create_bd_cell -type module -reference complex_phase_rotator complex_phase_rotator_0
set_property -dict {CONFIG.CHANNEL_SELECT 3} [get_bd_cells complex_phase_rotator_0]
create_bd_cell -type module -reference complex_phase_rotator complex_phase_rotator_1
set_property -dict {CONFIG.CHANNEL_SELECT 4} [get_bd_cells complex_phase_rotator_1]
create_bd_cell -type module -reference complex_phase_rotator complex_phase_rotator_2
create_bd_cell -type module -reference complex_phase_rotator complex_phase_rotator_3
set_property -dict {CONFIG.CHANNEL_SELECT 5} [get_bd_cells complex_phase_rotator_3]
create_bd_cell -type module -reference complex_phase_rotator complex_phase_rotator_4
set_property -dict {CONFIG.CHANNEL_SELECT 1} [get_bd_cells complex_phase_rotator_4]
create_bd_cell -type module -reference complex_phase_rotator complex_phase_rotator_5
set_property -dict {CONFIG.CHANNEL_SELECT 2} [get_bd_cells complex_phase_rotator_5]
create_bd_cell -type module -reference axis_fft_window axis_fft_window_0

# ---- connections ----

connect_bd_intf_net [get_bd_intf_pins axis_data_fifo_2/M_AXIS] [get_bd_intf_pins axis_fft_frame_mux_0/s01_axis]
connect_bd_intf_net [get_bd_intf_pins fft_ctrl_0/m_axis_config] [get_bd_intf_pins xfft_0/S_AXIS_CONFIG]
connect_bd_intf_net [get_bd_intf_pins data_split_0/m02_axis] [get_bd_intf_pins IQ_Mixer_axi_2/s_axis_adc]
connect_bd_intf_net [get_bd_intf_pins fir_compiler_20/M_AXIS_DATA] [get_bd_intf_pins fir_compiler_21/S_AXIS_DATA]
connect_bd_intf_net [get_bd_intf_pins axis_broadcaster_4/M00_AXIS] [get_bd_intf_pins axis_data_fifo_4/S_AXIS]
connect_bd_intf_net [get_bd_intf_pins IQ_Mixer_axi_2/m_axis_i] [get_bd_intf_pins fir_compiler_8/S_AXIS_DATA]
connect_bd_intf_net [get_bd_intf_ports pha_axi] [get_bd_intf_pins beamformer_sum_0/m_axis]
connect_bd_intf_net [get_bd_intf_pins data_split_0/m04_axis] [get_bd_intf_pins IQ_Mixer_axi_4/s_axis_adc]
connect_bd_intf_net [get_bd_intf_pins fir_compiler_5/M_AXIS_DATA] [get_bd_intf_pins axis_fir_to_fft_1/s_axis_i]
connect_bd_intf_net [get_bd_intf_pins fir_compiler_10/M_AXIS_DATA] [get_bd_intf_pins fir_compiler_11/S_AXIS_DATA]
connect_bd_intf_net -intf_net s_axis_0_1 [get_bd_intf_ports adc_axi] [get_bd_intf_pins data_split_0/s_axis]
connect_bd_intf_net [get_bd_intf_pins IQ_Mixer_axi_0/m_axis_q] [get_bd_intf_pins fir_compiler_2/S_AXIS_DATA]
connect_bd_intf_net [get_bd_intf_pins complex_phase_rotator_4/m_axis] [get_bd_intf_pins beamformer_sum_0/s01_axis]
connect_bd_intf_net [get_bd_intf_pins axis_broadcaster_4/M01_AXIS] [get_bd_intf_pins complex_phase_rotator_0/s_axis]
connect_bd_intf_net [get_bd_intf_pins fir_compiler_6/M_AXIS_DATA] [get_bd_intf_pins fir_compiler_7/S_AXIS_DATA]
connect_bd_intf_net [get_bd_intf_pins fir_compiler_8/M_AXIS_DATA] [get_bd_intf_pins fir_compiler_9/S_AXIS_DATA]
connect_bd_intf_net [get_bd_intf_pins axis_broadcaster_0/M04_AXIS] [get_bd_intf_pins IQ_Mixer_axi_4/s_axis_dds]
connect_bd_intf_net [get_bd_intf_pins xfft_0/M_AXIS_DATA] [get_bd_intf_pins axis_fft_result_0/s_axis_fft]
connect_bd_intf_net [get_bd_intf_pins fir_compiler_11/M_AXIS_DATA] [get_bd_intf_pins axis_fir_to_fft_2/s_axis_q]
connect_bd_intf_net [get_bd_intf_pins axis_data_fifo_4/M_AXIS] [get_bd_intf_pins axis_fft_frame_mux_0/s03_axis]
connect_bd_intf_net [get_bd_intf_pins axis_fir_to_fft_4/m_axis_fft] [get_bd_intf_pins axis_broadcaster_5/S_AXIS]
connect_bd_intf_net [get_bd_intf_pins fir_compiler_17/M_AXIS_DATA] [get_bd_intf_pins axis_fir_to_fft_4/s_axis_i]
connect_bd_intf_net [get_bd_intf_pins fir_compiler_19/M_AXIS_DATA] [get_bd_intf_pins axis_fir_to_fft_4/s_axis_q]
connect_bd_intf_net [get_bd_intf_pins axis_fir_to_fft_5/m_axis_fft] [get_bd_intf_pins axis_broadcaster_6/S_AXIS]
connect_bd_intf_net [get_bd_intf_pins complex_phase_rotator_1/m_axis] [get_bd_intf_pins beamformer_sum_0/s04_axis]
connect_bd_intf_net [get_bd_intf_pins axis_fft_window_0/m_axis_fft] [get_bd_intf_pins xfft_0/S_AXIS_DATA]
connect_bd_intf_net [get_bd_intf_pins axis_fft_frame_mux_0/m_axis_channel] [get_bd_intf_pins axis_data_fifo_7/S_AXIS]
connect_bd_intf_net [get_bd_intf_pins fir_compiler_7/M_AXIS_DATA] [get_bd_intf_pins axis_fir_to_fft_1/s_axis_q]
connect_bd_intf_net [get_bd_intf_pins axis_broadcaster_6/M01_AXIS] [get_bd_intf_pins complex_phase_rotator_3/s_axis]
connect_bd_intf_net [get_bd_intf_pins axis_broadcaster_0/M03_AXIS] [get_bd_intf_pins IQ_Mixer_axi_3/s_axis_dds]
connect_bd_intf_net [get_bd_intf_pins fir_compiler_18/M_AXIS_DATA] [get_bd_intf_pins fir_compiler_19/S_AXIS_DATA]
connect_bd_intf_net [get_bd_intf_pins IQ_Mixer_axi_4/m_axis_q] [get_bd_intf_pins fir_compiler_18/S_AXIS_DATA]
connect_bd_intf_net [get_bd_intf_pins axis_fir_to_fft_3/m_axis_fft] [get_bd_intf_pins axis_broadcaster_4/S_AXIS]
connect_bd_intf_net [get_bd_intf_pins axis_broadcaster_5/M01_AXIS] [get_bd_intf_pins complex_phase_rotator_1/s_axis]
connect_bd_intf_net [get_bd_intf_pins axis_fir_to_fft_1/m_axis_fft] [get_bd_intf_pins axis_broadcaster_2/S_AXIS]
connect_bd_intf_net [get_bd_intf_pins fir_compiler_16/M_AXIS_DATA] [get_bd_intf_pins fir_compiler_17/S_AXIS_DATA]
connect_bd_intf_net [get_bd_intf_pins dds_compiler_0/M_AXIS_DATA] [get_bd_intf_pins axis_broadcaster_0/S_AXIS]
connect_bd_intf_net [get_bd_intf_pins fir_compiler_21/M_AXIS_DATA] [get_bd_intf_pins axis_fir_to_fft_5/s_axis_i]
connect_bd_intf_net [get_bd_intf_pins data_split_0/m05_axis] [get_bd_intf_pins IQ_Mixer_axi_5/s_axis_adc]
connect_bd_intf_net [get_bd_intf_pins axis_broadcaster_1/M00_AXIS] [get_bd_intf_pins axis_data_fifo_1/S_AXIS]
connect_bd_intf_net [get_bd_intf_pins data_split_0/m03_axis] [get_bd_intf_pins IQ_Mixer_axi_3/s_axis_adc]
connect_bd_intf_net [get_bd_intf_pins fir_compiler_9/M_AXIS_DATA] [get_bd_intf_pins axis_fir_to_fft_2/s_axis_i]
connect_bd_intf_net [get_bd_intf_pins axis_data_fifo_3/M_AXIS] [get_bd_intf_pins axis_fft_frame_mux_0/s02_axis]
connect_bd_intf_net [get_bd_intf_pins fir_compiler_10/S_AXIS_DATA] [get_bd_intf_pins IQ_Mixer_axi_2/m_axis_q]
connect_bd_intf_net [get_bd_intf_pins complex_phase_rotator_5/s_axis] [get_bd_intf_pins axis_broadcaster_3/M01_AXIS]
connect_bd_intf_net [get_bd_intf_pins fir_compiler_3/M_AXIS_DATA] [get_bd_intf_pins axis_fir_to_fft_0/s_axis_q]
connect_bd_intf_net [get_bd_intf_pins axis_broadcaster_0/M00_AXIS] [get_bd_intf_pins IQ_Mixer_axi_0/s_axis_dds]
connect_bd_intf_net [get_bd_intf_pins IQ_Mixer_axi_4/m_axis_i] [get_bd_intf_pins fir_compiler_16/S_AXIS_DATA]
connect_bd_intf_net [get_bd_intf_pins axis_broadcaster_0/M01_AXIS] [get_bd_intf_pins IQ_Mixer_axi_1/s_axis_dds]
connect_bd_intf_net [get_bd_intf_pins fir_compiler_12/S_AXIS_DATA] [get_bd_intf_pins IQ_Mixer_axi_3/m_axis_i]
connect_bd_intf_net [get_bd_intf_ports fft_axi] [get_bd_intf_pins axis_fft_result_0/m_axis_result]
connect_bd_intf_net [get_bd_intf_pins fir_compiler_15/M_AXIS_DATA] [get_bd_intf_pins axis_fir_to_fft_3/s_axis_q]
connect_bd_intf_net [get_bd_intf_pins complex_phase_rotator_5/m_axis] [get_bd_intf_pins beamformer_sum_0/s02_axis]
connect_bd_intf_net [get_bd_intf_pins axis_data_fifo_6/M_AXIS] [get_bd_intf_pins axis_fft_frame_mux_0/s05_axis]
connect_bd_intf_net [get_bd_intf_pins axis_data_fifo_5/M_AXIS] [get_bd_intf_pins axis_fft_frame_mux_0/s04_axis]
connect_bd_intf_net [get_bd_intf_pins IQ_Mixer_axi_1/m_axis_i] [get_bd_intf_pins fir_compiler_4/S_AXIS_DATA]
connect_bd_intf_net [get_bd_intf_pins axis_fir_to_fft_0/m_axis_fft] [get_bd_intf_pins axis_broadcaster_1/S_AXIS]
connect_bd_intf_net [get_bd_intf_pins axis_broadcaster_2/M00_AXIS] [get_bd_intf_pins axis_data_fifo_2/S_AXIS]
connect_bd_intf_net [get_bd_intf_pins fir_compiler_4/M_AXIS_DATA] [get_bd_intf_pins fir_compiler_5/S_AXIS_DATA]
connect_bd_intf_net [get_bd_intf_pins axis_data_fifo_7/M_AXIS] [get_bd_intf_pins axis_fft_result_0/s_axis_channel]
connect_bd_intf_net [get_bd_intf_pins axis_broadcaster_3/M00_AXIS] [get_bd_intf_pins axis_data_fifo_3/S_AXIS]
connect_bd_intf_net [get_bd_intf_pins fir_compiler_20/S_AXIS_DATA] [get_bd_intf_pins IQ_Mixer_axi_5/m_axis_i]
connect_bd_intf_net [get_bd_intf_pins data_split_0/m01_axis] [get_bd_intf_pins IQ_Mixer_axi_1/s_axis_adc]
connect_bd_intf_net [get_bd_intf_pins fir_compiler_0/M_AXIS_DATA] [get_bd_intf_pins fir_compiler_1/S_AXIS_DATA]
connect_bd_intf_net [get_bd_intf_pins fir_compiler_22/M_AXIS_DATA] [get_bd_intf_pins fir_compiler_23/S_AXIS_DATA]
connect_bd_intf_net [get_bd_intf_pins fir_compiler_12/M_AXIS_DATA] [get_bd_intf_pins fir_compiler_13/S_AXIS_DATA]
connect_bd_intf_net [get_bd_intf_pins axis_broadcaster_5/M00_AXIS] [get_bd_intf_pins axis_data_fifo_5/S_AXIS]
connect_bd_intf_net [get_bd_intf_pins fir_compiler_22/S_AXIS_DATA] [get_bd_intf_pins IQ_Mixer_axi_5/m_axis_q]
connect_bd_intf_net [get_bd_intf_pins data_split_0/m00_axis] [get_bd_intf_pins IQ_Mixer_axi_0/s_axis_adc]
connect_bd_intf_net [get_bd_intf_pins axis_fir_to_fft_2/m_axis_fft] [get_bd_intf_pins axis_broadcaster_3/S_AXIS]
connect_bd_intf_net [get_bd_intf_pins fir_compiler_2/M_AXIS_DATA] [get_bd_intf_pins fir_compiler_3/S_AXIS_DATA]
connect_bd_intf_net [get_bd_intf_pins axis_broadcaster_0/M05_AXIS] [get_bd_intf_pins IQ_Mixer_axi_5/s_axis_dds]
connect_bd_intf_net [get_bd_intf_pins IQ_Mixer_axi_1/m_axis_q] [get_bd_intf_pins fir_compiler_6/S_AXIS_DATA]
connect_bd_intf_net [get_bd_intf_pins fir_compiler_13/M_AXIS_DATA] [get_bd_intf_pins axis_fir_to_fft_3/s_axis_i]
connect_bd_intf_net [get_bd_intf_pins axis_broadcaster_0/M02_AXIS] [get_bd_intf_pins IQ_Mixer_axi_2/s_axis_dds]
connect_bd_intf_net [get_bd_intf_pins axis_broadcaster_1/M01_AXIS] [get_bd_intf_pins complex_phase_rotator_2/s_axis]
connect_bd_intf_net [get_bd_intf_pins complex_phase_rotator_0/m_axis] [get_bd_intf_pins beamformer_sum_0/s03_axis]
connect_bd_intf_net [get_bd_intf_pins complex_phase_rotator_3/m_axis] [get_bd_intf_pins beamformer_sum_0/s05_axis]
connect_bd_intf_net [get_bd_intf_pins fir_compiler_14/S_AXIS_DATA] [get_bd_intf_pins IQ_Mixer_axi_3/m_axis_q]
connect_bd_intf_net [get_bd_intf_pins complex_phase_rotator_2/m_axis] [get_bd_intf_pins beamformer_sum_0/s00_axis]
connect_bd_intf_net [get_bd_intf_pins axis_data_fifo_1/M_AXIS] [get_bd_intf_pins axis_fft_frame_mux_0/s00_axis]
connect_bd_intf_net [get_bd_intf_pins axis_broadcaster_6/M00_AXIS] [get_bd_intf_pins axis_data_fifo_6/S_AXIS]
connect_bd_intf_net [get_bd_intf_pins fir_compiler_14/M_AXIS_DATA] [get_bd_intf_pins fir_compiler_15/S_AXIS_DATA]
connect_bd_intf_net [get_bd_intf_pins axis_fft_frame_mux_0/m_axis_fft] [get_bd_intf_pins axis_fft_window_0/s_axis_fft]
connect_bd_intf_net [get_bd_intf_pins IQ_Mixer_axi_0/m_axis_i] [get_bd_intf_pins fir_compiler_0/S_AXIS_DATA]
connect_bd_intf_net [get_bd_intf_pins dds_ctrl_0/m_axis] [get_bd_intf_pins dds_compiler_0/S_AXIS_CONFIG]
connect_bd_intf_net [get_bd_intf_pins fir_compiler_23/M_AXIS_DATA] [get_bd_intf_pins axis_fir_to_fft_5/s_axis_q]
connect_bd_intf_net [get_bd_intf_pins complex_phase_rotator_4/s_axis] [get_bd_intf_pins axis_broadcaster_2/M01_AXIS]
connect_bd_intf_net [get_bd_intf_pins fir_compiler_1/M_AXIS_DATA] [get_bd_intf_pins axis_fir_to_fft_0/s_axis_i]
connect_bd_net -net data_0_1 [get_bd_ports dds_fre] [get_bd_pins dds_ctrl_0/data]
connect_bd_net [get_bd_pins axis_fir_to_fft_0/overflow_error] [get_bd_pins error_concatenation_0/error_1]
connect_bd_net [get_bd_pins axis_fir_to_fft_1/overflow_error] [get_bd_pins error_concatenation_0/error_2]
connect_bd_net [get_bd_pins axis_fir_to_fft_2/overflow_error] [get_bd_pins error_concatenation_0/error_3]
connect_bd_net [get_bd_pins axis_fir_to_fft_3/overflow_error] [get_bd_pins error_concatenation_0/error_4]
connect_bd_net [get_bd_pins axis_fir_to_fft_4/overflow_error] [get_bd_pins error_concatenation_0/error_5]
connect_bd_net [get_bd_pins axis_fir_to_fft_5/overflow_error] [get_bd_pins error_concatenation_0/error_6]
connect_bd_net [get_bd_pins error_concatenation_0/error_concat] [get_bd_ports fir_fft_trans_err]
connect_bd_net -net aclk_0_1 [get_bd_ports aclk] \
  [get_bd_pins dds_ctrl_0/aclk] [get_bd_pins dds_compiler_0/aclk] [get_bd_pins data_split_0/aclk] \
  [get_bd_pins axis_broadcaster_0/aclk] [get_bd_pins IQ_Mixer_axi_0/aclk] [get_bd_pins IQ_Mixer_axi_1/aclk] \
  [get_bd_pins IQ_Mixer_axi_2/aclk] [get_bd_pins IQ_Mixer_axi_3/aclk] [get_bd_pins IQ_Mixer_axi_4/aclk] \
  [get_bd_pins IQ_Mixer_axi_5/aclk] [get_bd_pins axis_broadcaster_2/aclk] [get_bd_pins axis_broadcaster_1/aclk] \
  [get_bd_pins axis_broadcaster_3/aclk] [get_bd_pins fft_ctrl_0/aclk] [get_bd_pins axis_broadcaster_6/aclk] \
  [get_bd_pins axis_broadcaster_5/aclk] [get_bd_pins axis_broadcaster_4/aclk] [get_bd_pins xfft_0/aclk] \
  [get_bd_pins fir_compiler_0/aclk] [get_bd_pins fir_compiler_1/aclk] [get_bd_pins fir_compiler_2/aclk] \
  [get_bd_pins fir_compiler_3/aclk] [get_bd_pins fir_compiler_4/aclk] [get_bd_pins fir_compiler_5/aclk] \
  [get_bd_pins fir_compiler_6/aclk] [get_bd_pins fir_compiler_7/aclk] [get_bd_pins fir_compiler_8/aclk] \
  [get_bd_pins fir_compiler_9/aclk] [get_bd_pins fir_compiler_10/aclk] [get_bd_pins fir_compiler_11/aclk] \
  [get_bd_pins fir_compiler_12/aclk] [get_bd_pins fir_compiler_13/aclk] [get_bd_pins fir_compiler_14/aclk] \
  [get_bd_pins fir_compiler_15/aclk] [get_bd_pins fir_compiler_16/aclk] [get_bd_pins fir_compiler_17/aclk] \
  [get_bd_pins fir_compiler_18/aclk] [get_bd_pins fir_compiler_19/aclk] [get_bd_pins fir_compiler_20/aclk] \
  [get_bd_pins fir_compiler_21/aclk] [get_bd_pins fir_compiler_22/aclk] [get_bd_pins fir_compiler_23/aclk] \
  [get_bd_pins axis_data_fifo_1/s_axis_aclk] [get_bd_pins axis_data_fifo_2/s_axis_aclk] \
  [get_bd_pins axis_data_fifo_3/s_axis_aclk] [get_bd_pins axis_data_fifo_4/s_axis_aclk] \
  [get_bd_pins axis_data_fifo_5/s_axis_aclk] [get_bd_pins axis_data_fifo_6/s_axis_aclk] \
  [get_bd_pins axis_fft_frame_mux_0/aclk] [get_bd_pins axis_data_fifo_7/s_axis_aclk] [get_bd_pins axis_fft_result_0/aclk] \
  [get_bd_pins axis_fir_to_fft_0/aclk] [get_bd_pins axis_fir_to_fft_1/aclk] [get_bd_pins axis_fir_to_fft_2/aclk] \
  [get_bd_pins axis_fir_to_fft_3/aclk] [get_bd_pins axis_fir_to_fft_4/aclk] [get_bd_pins axis_fir_to_fft_5/aclk] \
  [get_bd_pins beamformer_sum_0/aclk] [get_bd_pins complex_phase_rotator_0/aclk] [get_bd_pins complex_phase_rotator_1/aclk] \
  [get_bd_pins complex_phase_rotator_2/aclk] [get_bd_pins complex_phase_rotator_3/aclk] \
  [get_bd_pins complex_phase_rotator_4/aclk] [get_bd_pins complex_phase_rotator_5/aclk] [get_bd_pins axis_fft_window_0/aclk]
